# Altium schematic sheet CW341_Edge.SchDoc: CW331 Edge Interface
size Letter; Organization: NewAE Technology Inc.; Address1: 1083 Queen St., Suite 196; Address2: Halifax; Address3: NS; Address4: Canada B3H 0B2; SheetNumber: 1; SheetTotal: 16; SheetApproved: YES
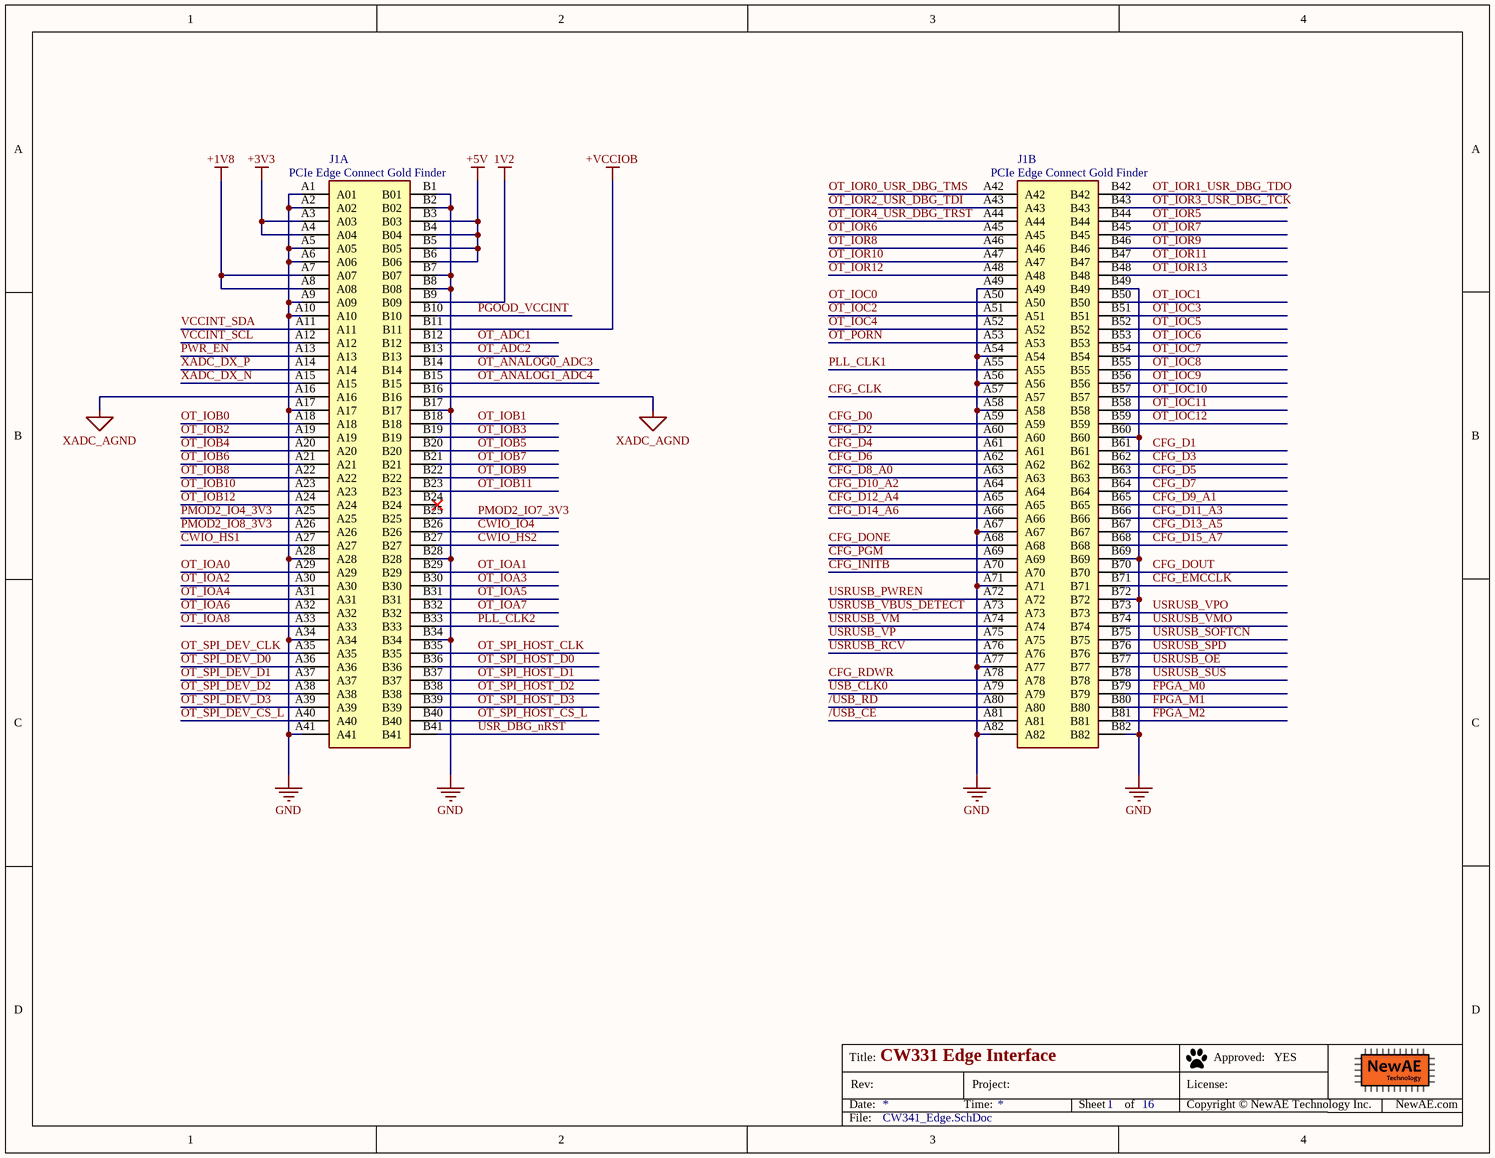
[diagram p0: CW341_Edge.SchDoc]

## Parts
J1  PCIe Edge Connect Gold Finder  [PCIeX16-GF-2D-1000-1K-O164]  (parts A,B of 2)

## Nets
1V2: J1.B9(B09)
+1V8: J1.A7(A07) J1.A8(A08)
+3V3: J1.A3(A03) J1.A4(A04)
+5V: J1.B3(B03) J1.B4(B04) J1.B5(B05) J1.B6(B06)
+VCCIOB: J1.B11
GND: J1.A1(A01) J1.A2(A02) J1.A5(A05) J1.A6(A06) J1.A9(A09) J1.A10 J1.A17 J1.A28 J1.A34 J1.A41 J1.A49 J1.A54 J1.A56 J1.A58 J1.A67 J1.A71 J1.A77 J1.A82 J1.B1(B01) J1.B2(B02) J1.B7(B07) J1.B8(B08) J1.B17 J1.B28 J1.B34 J1.B49 J1.B60 J1.B69 J1.B72 J1.B82
XADC_AGND: J1.A16 J1.B16
/USB_CE: J1.A81
/USB_RD: J1.A80
CFG_CLK: J1.A57
CFG_D0: J1.A59
CFG_D1: J1.B61
CFG_D2: J1.A60
CFG_D3: J1.B62
CFG_D4: J1.A61
CFG_D5: J1.B63
CFG_D6: J1.A62
CFG_D7: J1.B64
CFG_D8_A0: J1.A63
CFG_D9_A1: J1.B65
CFG_D10_A2: J1.A64
CFG_D11_A3: J1.B66
CFG_D12_A4: J1.A65
CFG_D13_A5: J1.B67
CFG_D14_A6: J1.A66
CFG_D15_A7: J1.B68
CFG_DONE: J1.A68
CFG_DOUT: J1.B70
CFG_EMCCLK: J1.B71
CFG_INITB: J1.A70
CFG_PGM: J1.A69
CFG_RDWR: J1.A78
CWIO_HS1: J1.A27
CWIO_HS2: J1.B27
CWIO_IO4: J1.B26
FPGA_M0: J1.B79
FPGA_M1: J1.B80
FPGA_M2: J1.B81
OT_ADC1: J1.B12
OT_ADC2: J1.B13
OT_ANALOG0_ADC3: J1.B14
OT_ANALOG1_ADC4: J1.B15
OT_IOA0: J1.A29
OT_IOA1: J1.B29
OT_IOA2: J1.A30
OT_IOA3: J1.B30
OT_IOA4: J1.A31
OT_IOA5: J1.B31
OT_IOA6: J1.A32
OT_IOA7: J1.B32
OT_IOA8: J1.A33
OT_IOB0: J1.A18
OT_IOB1: J1.B18
OT_IOB2: J1.A19
OT_IOB3: J1.B19
OT_IOB4: J1.A20
OT_IOB5: J1.B20
OT_IOB6: J1.A21
OT_IOB7: J1.B21
OT_IOB8: J1.A22
OT_IOB9: J1.B22
OT_IOB10: J1.A23
OT_IOB11: J1.B23
OT_IOB12: J1.A24
OT_IOC0: J1.A50
OT_IOC1: J1.B50
OT_IOC2: J1.A51
OT_IOC3: J1.B51
OT_IOC4: J1.A52
OT_IOC5: J1.B52
OT_IOC6: J1.B53
OT_IOC7: J1.B54
OT_IOC8: J1.B55
OT_IOC9: J1.B56
OT_IOC10: J1.B57
OT_IOC11: J1.B58
OT_IOC12: J1.B59
OT_IOR0_USR_DBG_TMS: J1.A42
OT_IOR1_USR_DBG_TDO: J1.B42
OT_IOR2_USR_DBG_TDI: J1.A43
OT_IOR3_USR_DBG_TCK: J1.B43
OT_IOR4_USR_DBG_TRST: J1.A44
OT_IOR5: J1.B44
OT_IOR6: J1.A45
OT_IOR7: J1.B45
OT_IOR8: J1.A46
OT_IOR9: J1.B46
OT_IOR10: J1.A47
OT_IOR11: J1.B47
OT_IOR12: J1.A48
OT_IOR13: J1.B48
OT_PORN: J1.A53
OT_SPI_DEV_CLK: J1.A35
OT_SPI_DEV_CS_L: J1.A40
OT_SPI_DEV_D0: J1.A36
OT_SPI_DEV_D1: J1.A37
OT_SPI_DEV_D2: J1.A38
OT_SPI_DEV_D3: J1.A39
OT_SPI_HOST_CLK: J1.B35
OT_SPI_HOST_CS_L: J1.B40
OT_SPI_HOST_D0: J1.B36
OT_SPI_HOST_D1: J1.B37
OT_SPI_HOST_D2: J1.B38
OT_SPI_HOST_D3: J1.B39
PGOOD_VCCINT: J1.B10
PLL_CLK1: J1.A55
PLL_CLK2: J1.B33
PMOD2_IO4_3V3: J1.A25
PMOD2_IO7_3V3: J1.B25
PMOD2_IO8_3V3: J1.A26
PWR_EN: J1.A13
USB_CLK0: J1.A79
USR_DBG_nRST: J1.B41
USRUSB_OE: J1.B77
USRUSB_PWREN: J1.A72
USRUSB_RCV: J1.A76
USRUSB_SOFTCN: J1.B75
USRUSB_SPD: J1.B76
USRUSB_SUS: J1.B78
USRUSB_VBUS_DETECT: J1.A73
USRUSB_VM: J1.A74
USRUSB_VMO: J1.B74
USRUSB_VP: J1.A75
USRUSB_VPO: J1.B73
VCCINT_SCL: J1.A12
VCCINT_SDA: J1.A11
XADC_DX_N: J1.A15
XADC_DX_P: J1.A14

Not connected (* = marked no-connect by the designer): J1 B24*

## Notes on the sheet
- Title:
- Date:
- Rev:
- Time:
- Project:
- Sheet
- of
- License:
- Copyright © NewAE Technology Inc.
- Approved:
- NewAE.com
- File:

## Library data of the parts
J1 = PCIe x16 Connector Edge (gold finger, x8 mode): Edge Fingers No Part to Install; MF: NA; MP: PCIE-164-02-X-D-RA; Value: *; Price: NA; Package: PCIeX16-GF-2D-1000-1K-O164